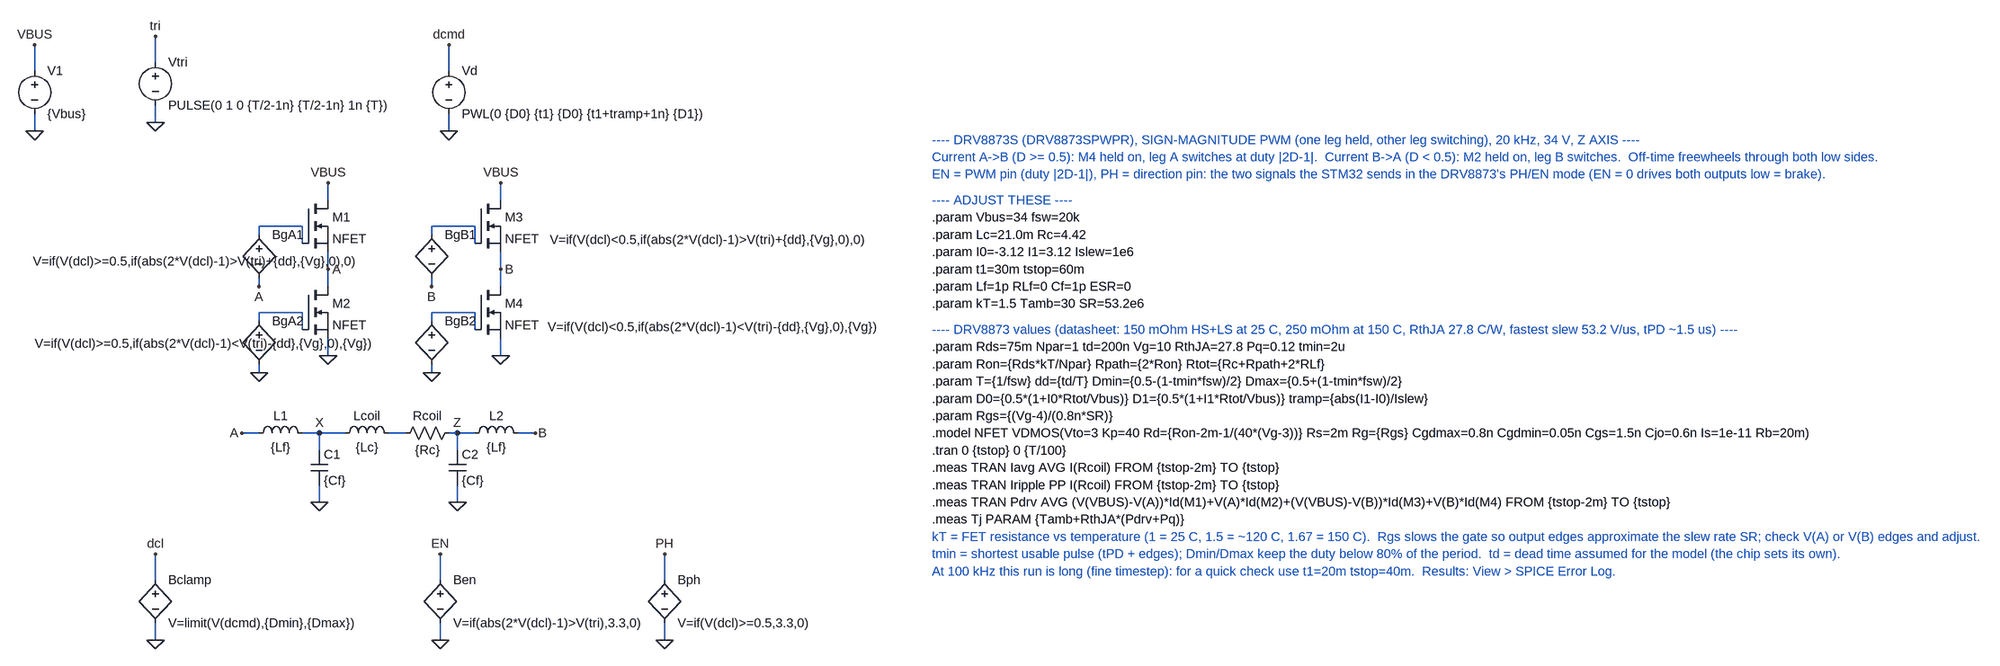
[diagram p0: schematic helmholtz_drv8873_signmag_100k_34V_20kHz.asc]
helmholtz_drv8873_signmag_100k_34V_20kHz.asc, the LTspice schematic file:
Version 4.1
SHEET 1 3464 948
WIRE 48 -144 48 -192
WIRE -176 -128 -176 -176
WIRE 592 -128 592 -176
WIRE 48 -32 48 -64
WIRE -176 -16 -176 -48
WIRE 592 -16 592 -48
WIRE 368 112 368 80
WIRE 688 112 688 80
WIRE 320 160 240 160
WIRE 640 160 560 160
WIRE 240 176 240 160
WIRE 560 176 560 160
WIRE 320 192 320 160
WIRE 640 192 640 160
WIRE 368 240 368 208
WIRE 688 240 688 208
WIRE 240 272 240 256
WIRE 368 272 368 240
WIRE 560 272 560 256
WIRE 688 272 688 240
WIRE 320 320 240 320
WIRE 640 320 560 320
WIRE 240 336 240 320
WIRE 560 336 560 320
WIRE 320 352 320 320
WIRE 640 352 640 320
WIRE 368 400 368 368
WIRE 688 400 688 368
WIRE 240 432 240 416
WIRE 560 432 560 416
WIRE 240 544 208 544
WIRE 352 544 320 544
WIRE 400 544 352 544
WIRE 512 544 480 544
WIRE 608 544 592 544
WIRE 640 544 608 544
WIRE 752 544 720 544
WIRE 352 576 352 544
WIRE 608 576 608 544
WIRE 352 672 352 640
WIRE 608 672 608 640
WIRE 48 816 48 768
WIRE 576 816 576 768
WIRE 992 816 992 768
WIRE 48 928 48 896
WIRE 576 928 576 896
WIRE 992 928 992 896
FLAG -176 -176 VBUS
FLAG -176 -16 0
FLAG 368 80 VBUS
FLAG 368 240 A
FLAG 368 400 0
FLAG 240 272 A
FLAG 240 432 0
FLAG 688 80 VBUS
FLAG 688 240 B
FLAG 688 400 0
FLAG 560 272 B
FLAG 560 432 0
FLAG 208 544 A
FLAG 752 544 B
FLAG 352 544 X
FLAG 352 672 0
FLAG 608 544 Z
FLAG 608 672 0
FLAG 48 -192 tri
FLAG 48 -32 0
FLAG 592 -176 dcmd
FLAG 592 -16 0
FLAG 48 768 dcl
FLAG 48 928 0
FLAG 576 768 EN
FLAG 576 928 0
FLAG 992 768 PH
FLAG 992 928 0
SYMBOL voltage -176 -144 R0
SYMATTR InstName V1
SYMATTR Value {Vbus}
SYMBOL nmos 320 112 R0
SYMATTR InstName M1
SYMATTR Value NFET
SYMBOL nmos 320 272 R0
SYMATTR InstName M2
SYMATTR Value NFET
SYMBOL bv 240 160 R0
WINDOW 3 -419 65 Left 2
SYMATTR InstName BgA1
SYMATTR Value V=if(V(dcl)>=0.5,if(abs(2*V(dcl)-1)>V(tri)+{dd},{Vg},0),0)
SYMBOL bv 240 320 R0
WINDOW 3 -416 58 Left 2
SYMATTR InstName BgA2
SYMATTR Value V=if(V(dcl)>=0.5,if(abs(2*V(dcl)-1)<V(tri)-{dd},{Vg},0),{Vg})
SYMBOL nmos 640 112 R0
SYMATTR InstName M3
SYMATTR Value NFET
SYMBOL nmos 640 272 R0
SYMATTR InstName M4
SYMATTR Value NFET
SYMBOL bv 560 160 R0
WINDOW 3 219 25 Left 2
SYMATTR InstName BgB1
SYMATTR Value V=if(V(dcl)<0.5,if(abs(2*V(dcl)-1)>V(tri)+{dd},{Vg},0),0)
SYMBOL bv 560 320 R0
WINDOW 3 215 27 Left 2
SYMATTR InstName BgB2
SYMATTR Value V=if(V(dcl)<0.5,if(abs(2*V(dcl)-1)<V(tri)-{dd},{Vg},0),{Vg})
SYMBOL ind 224 560 R270
WINDOW 0 32 56 VTop 2
WINDOW 3 5 56 VBottom 2
SYMATTR InstName L1
SYMATTR Value {Lf}
SYMATTR SpiceLine Rser={RLf}
SYMBOL ind 384 560 R270
WINDOW 0 32 56 VTop 2
WINDOW 3 5 56 VBottom 2
SYMATTR InstName Lcoil
SYMATTR Value {Lc}
SYMBOL res 496 560 R270
WINDOW 0 32 56 VTop 2
WINDOW 3 0 56 VBottom 2
SYMATTR InstName Rcoil
SYMATTR Value {Rc}
SYMBOL ind 624 560 R270
WINDOW 0 32 56 VTop 2
WINDOW 3 5 56 VBottom 2
SYMATTR InstName L2
SYMATTR Value {Lf}
SYMATTR SpiceLine Rser={RLf}
SYMBOL cap 336 576 R0
SYMATTR InstName C1
SYMATTR Value {Cf}
SYMATTR SpiceLine Rser={ESR}
SYMBOL cap 592 576 R0
SYMATTR InstName C2
SYMATTR Value {Cf}
SYMATTR SpiceLine Rser={ESR}
SYMBOL voltage 48 -160 R0
SYMATTR InstName Vtri
SYMATTR Value PULSE(0 1 0 {T/2-1n} {T/2-1n} 1n {T})
SYMBOL voltage 592 -144 R0
SYMATTR InstName Vd
SYMATTR Value PWL(0 {D0} {t1} {D0} {t1+tramp+1n} {D1})
SYMBOL bv 48 800 R0
SYMATTR InstName Bclamp
SYMATTR Value V=limit(V(dcmd),{Dmin},{Dmax})
SYMBOL bv 576 800 R0
SYMATTR InstName Ben
SYMATTR Value V=if(abs(2*V(dcl)-1)>V(tri),3.3,0)
SYMBOL bv 992 800 R0
SYMATTR InstName Bph
SYMATTR Value V=if(V(dcl)>=0.5,3.3,0)
TEXT 1584 0 Left 2 ;---- DRV8873S (DRV8873SPWPR), SIGN-MAGNITUDE PWM (one leg held, other leg switching), 20 kHz, 34 V, Z AXIS ----
TEXT 1584 32 Left 2 ;Current A->B (D >= 0.5): M4 held on, leg A switches at duty |2D-1|.  Current B->A (D < 0.5): M2 held on, leg B switches.  Off-time freewheels through both low sides.
TEXT 1584 64 Left 2 ;EN = PWM pin (duty |2D-1|), PH = direction pin: the two signals the STM32 sends in the DRV8873's PH/EN mode (EN = 0 drives both outputs low = brake).
TEXT 1584 112 Left 2 ;---- ADJUST THESE ----
TEXT 1584 144 Left 2 !.param Vbus=34 fsw=20k
TEXT 1584 176 Left 2 !.param Lc=21.0m Rc=4.42
TEXT 1584 208 Left 2 !.param I0=-3.12 I1=3.12 Islew=1e6
TEXT 1584 240 Left 2 !.param t1=30m tstop=60m
TEXT 1584 272 Left 2 !.param Lf=1p RLf=0 Cf=1p ESR=0
TEXT 1584 304 Left 2 !.param kT=1.5 Tamb=30 SR=53.2e6
TEXT 1584 352 Left 2 ;---- DRV8873 values (datasheet: 150 mOhm HS+LS at 25 C, 250 mOhm at 150 C, RthJA 27.8 C/W, fastest slew 53.2 V/us, tPD ~1.5 us) ----
TEXT 1584 384 Left 2 !.param Rds=75m Npar=1 td=200n Vg=10 RthJA=27.8 Pq=0.12 tmin=2u
TEXT 1584 416 Left 2 !.param Ron={Rds*kT/Npar} Rpath={2*Ron} Rtot={Rc+Rpath+2*RLf}
TEXT 1584 448 Left 2 !.param T={1/fsw} dd={td/T} Dmin={0.5-(1-tmin*fsw)/2} Dmax={0.5+(1-tmin*fsw)/2}
TEXT 1584 480 Left 2 !.param D0={0.5*(1+I0*Rtot/Vbus)} D1={0.5*(1+I1*Rtot/Vbus)} tramp={abs(I1-I0)/Islew}
TEXT 1584 512 Left 2 !.param Rgs={(Vg-4)/(0.8n*SR)}
TEXT 1584 544 Left 2 !.model NFET VDMOS(Vto=3 Kp=40 Rd={Ron-2m-1/(40*(Vg-3))} Rs=2m Rg={Rgs} Cgdmax=0.8n Cgdmin=0.05n Cgs=1.5n Cjo=0.6n Is=1e-11 Rb=20m)
TEXT 1584 576 Left 2 !.tran 0 {tstop} 0 {T/100}
TEXT 1584 608 Left 2 !.meas TRAN Iavg AVG I(Rcoil) FROM {tstop-2m} TO {tstop}
TEXT 1584 640 Left 2 !.meas TRAN Iripple PP I(Rcoil) FROM {tstop-2m} TO {tstop}
TEXT 1584 672 Left 2 !.meas TRAN Pdrv AVG (V(VBUS)-V(A))*Id(M1)+V(A)*Id(M2)+(V(VBUS)-V(B))*Id(M3)+V(B)*Id(M4) FROM {tstop-2m} TO {tstop}
TEXT 1584 704 Left 2 !.meas Tj PARAM {Tamb+RthJA*(Pdrv+Pq)}
TEXT 1584 736 Left 2 ;kT = FET resistance vs temperature (1 = 25 C, 1.5 = ~120 C, 1.67 = 150 C).  Rgs slows the gate so output edges approximate the slew rate SR; check V(A) or V(B) edges and adjust.
TEXT 1584 768 Left 2 ;tmin = shortest usable pulse (tPD + edges); Dmin/Dmax keep the duty below 80% of the period.  td = dead time assumed for the model (the chip sets its own).
TEXT 1584 800 Left 2 ;At 100 kHz this run is long (fine timestep): for a quick check use t1=20m tstop=40m.  Results: View > SPICE Error Log.

The netlist it stands for:
* helmholtz_drv8873_signmag_100k_34V_20kHz.asc
V1 VBUS 0 {Vbus}
M1 VBUS N001 A A NFET
M2 A N003 0 0 NFET
BgA1 N001 A V=if(V(dcl)>=0.5,if(abs(2*V(dcl)-1)>V(tri)+{dd},{Vg},0),0)
BgA2 N003 0 V=if(V(dcl)>=0.5,if(abs(2*V(dcl)-1)<V(tri)-{dd},{Vg},0),{Vg})
M3 VBUS N002 B B NFET
M4 B N004 0 0 NFET
BgB1 N002 B V=if(V(dcl)<0.5,if(abs(2*V(dcl)-1)>V(tri)+{dd},{Vg},0),0)
BgB2 N004 0 V=if(V(dcl)<0.5,if(abs(2*V(dcl)-1)<V(tri)-{dd},{Vg},0),{Vg})
L1 A X {Lf} Rser={RLf}
Lcoil X N005 {Lc}
Rcoil N005 Z {Rc}
L2 Z B {Lf} Rser={RLf}
C1 X 0 {Cf} Rser={ESR}
C2 Z 0 {Cf} Rser={ESR}
Vtri tri 0 PULSE(0 1 0 {T/2-1n} {T/2-1n} 1n {T})
Vd dcmd 0 PWL(0 {D0} {t1} {D0} {t1+tramp+1n} {D1})
Bclamp dcl 0 V=limit(V(dcmd),{Dmin},{Dmax})
Ben EN 0 V=if(abs(2*V(dcl)-1)>V(tri),3.3,0)
Bph PH 0 V=if(V(dcl)>=0.5,3.3,0)
.model NMOS NMOS
.model PMOS PMOS
.lib standard.mos
* ---- DRV8873S (DRV8873SPWPR), SIGN-MAGNITUDE PWM (one leg held, other leg switching), 20 kHz, 34 V, Z AXIS ----
* Current A->B (D >= 0.5): M4 held on, leg A switches at duty |2D-1|.  Current B->A (D < 0.5): M2 held on, leg B switches.  Off-time freewheels through both low sides.
* EN = PWM pin (duty |2D-1|), PH = direction pin: the two signals the STM32 sends in the DRV8873's PH/EN mode (EN = 0 drives both outputs low = brake).
* ---- ADJUST THESE ----
.param Vbus=34 fsw=20k
.param Lc=21.0m Rc=4.42
.param I0=-3.12 I1=3.12 Islew=1e6
.param t1=30m tstop=60m
.param Lf=1p RLf=0 Cf=1p ESR=0
.param kT=1.5 Tamb=30 SR=53.2e6
* ---- DRV8873 values (datasheet: 150 mOhm HS+LS at 25 C, 250 mOhm at 150 C, RthJA 27.8 C/W, fastest slew 53.2 V/us, tPD ~1.5 us) ----
.param Rds=75m Npar=1 td=200n Vg=10 RthJA=27.8 Pq=0.12 tmin=2u
.param Ron={Rds*kT/Npar} Rpath={2*Ron} Rtot={Rc+Rpath+2*RLf}
.param T={1/fsw} dd={td/T} Dmin={0.5-(1-tmin*fsw)/2} Dmax={0.5+(1-tmin*fsw)/2}
.param D0={0.5*(1+I0*Rtot/Vbus)} D1={0.5*(1+I1*Rtot/Vbus)} tramp={abs(I1-I0)/Islew}
.param Rgs={(Vg-4)/(0.8n*SR)}
.model NFET VDMOS(Vto=3 Kp=40 Rd={Ron-2m-1/(40*(Vg-3))} Rs=2m Rg={Rgs} Cgdmax=0.8n Cgdmin=0.05n Cgs=1.5n Cjo=0.6n Is=1e-11 Rb=20m)
.tran 0 {tstop} 0 {T/100}
.meas TRAN Iavg AVG I(Rcoil) FROM {tstop-2m} TO {tstop}
.meas TRAN Iripple PP I(Rcoil) FROM {tstop-2m} TO {tstop}
.meas TRAN Pdrv AVG (V(VBUS)-V(A))*Id(M1)+V(A)*Id(M2)+(V(VBUS)-V(B))*Id(M3)+V(B)*Id(M4) FROM {tstop-2m} TO {tstop}
.meas Tj PARAM {Tamb+RthJA*(Pdrv+Pq)}
* kT = FET resistance vs temperature (1 = 25 C, 1.5 = ~120 C, 1.67 = 150 C).  Rgs slows the gate so output edges approximate the slew rate SR; check V(A) or V(B) edges and adjust.
* tmin = shortest usable pulse (tPD + edges); Dmin/Dmax keep the duty below 80% of the period.  td = dead time assumed for the model (the chip sets its own).
* At 100 kHz this run is long (fine timestep): for a quick check use t1=20m tstop=40m.  Results: View > SPICE Error Log.
.backanno
.end